# EasyEDA Pro project ProPrj_H750VBT6M2_2025-05-18.epro

# Schematic Schematic1
Board Name: Board1; Create Date: 2025-05-16; Page Name: P1; Project Name: H750VBT6M2; Schematic Name: Schematic1; Update Date: 2025-05-18; Company: 嘉立创EDA; Page Size: A4; Version: V1.0
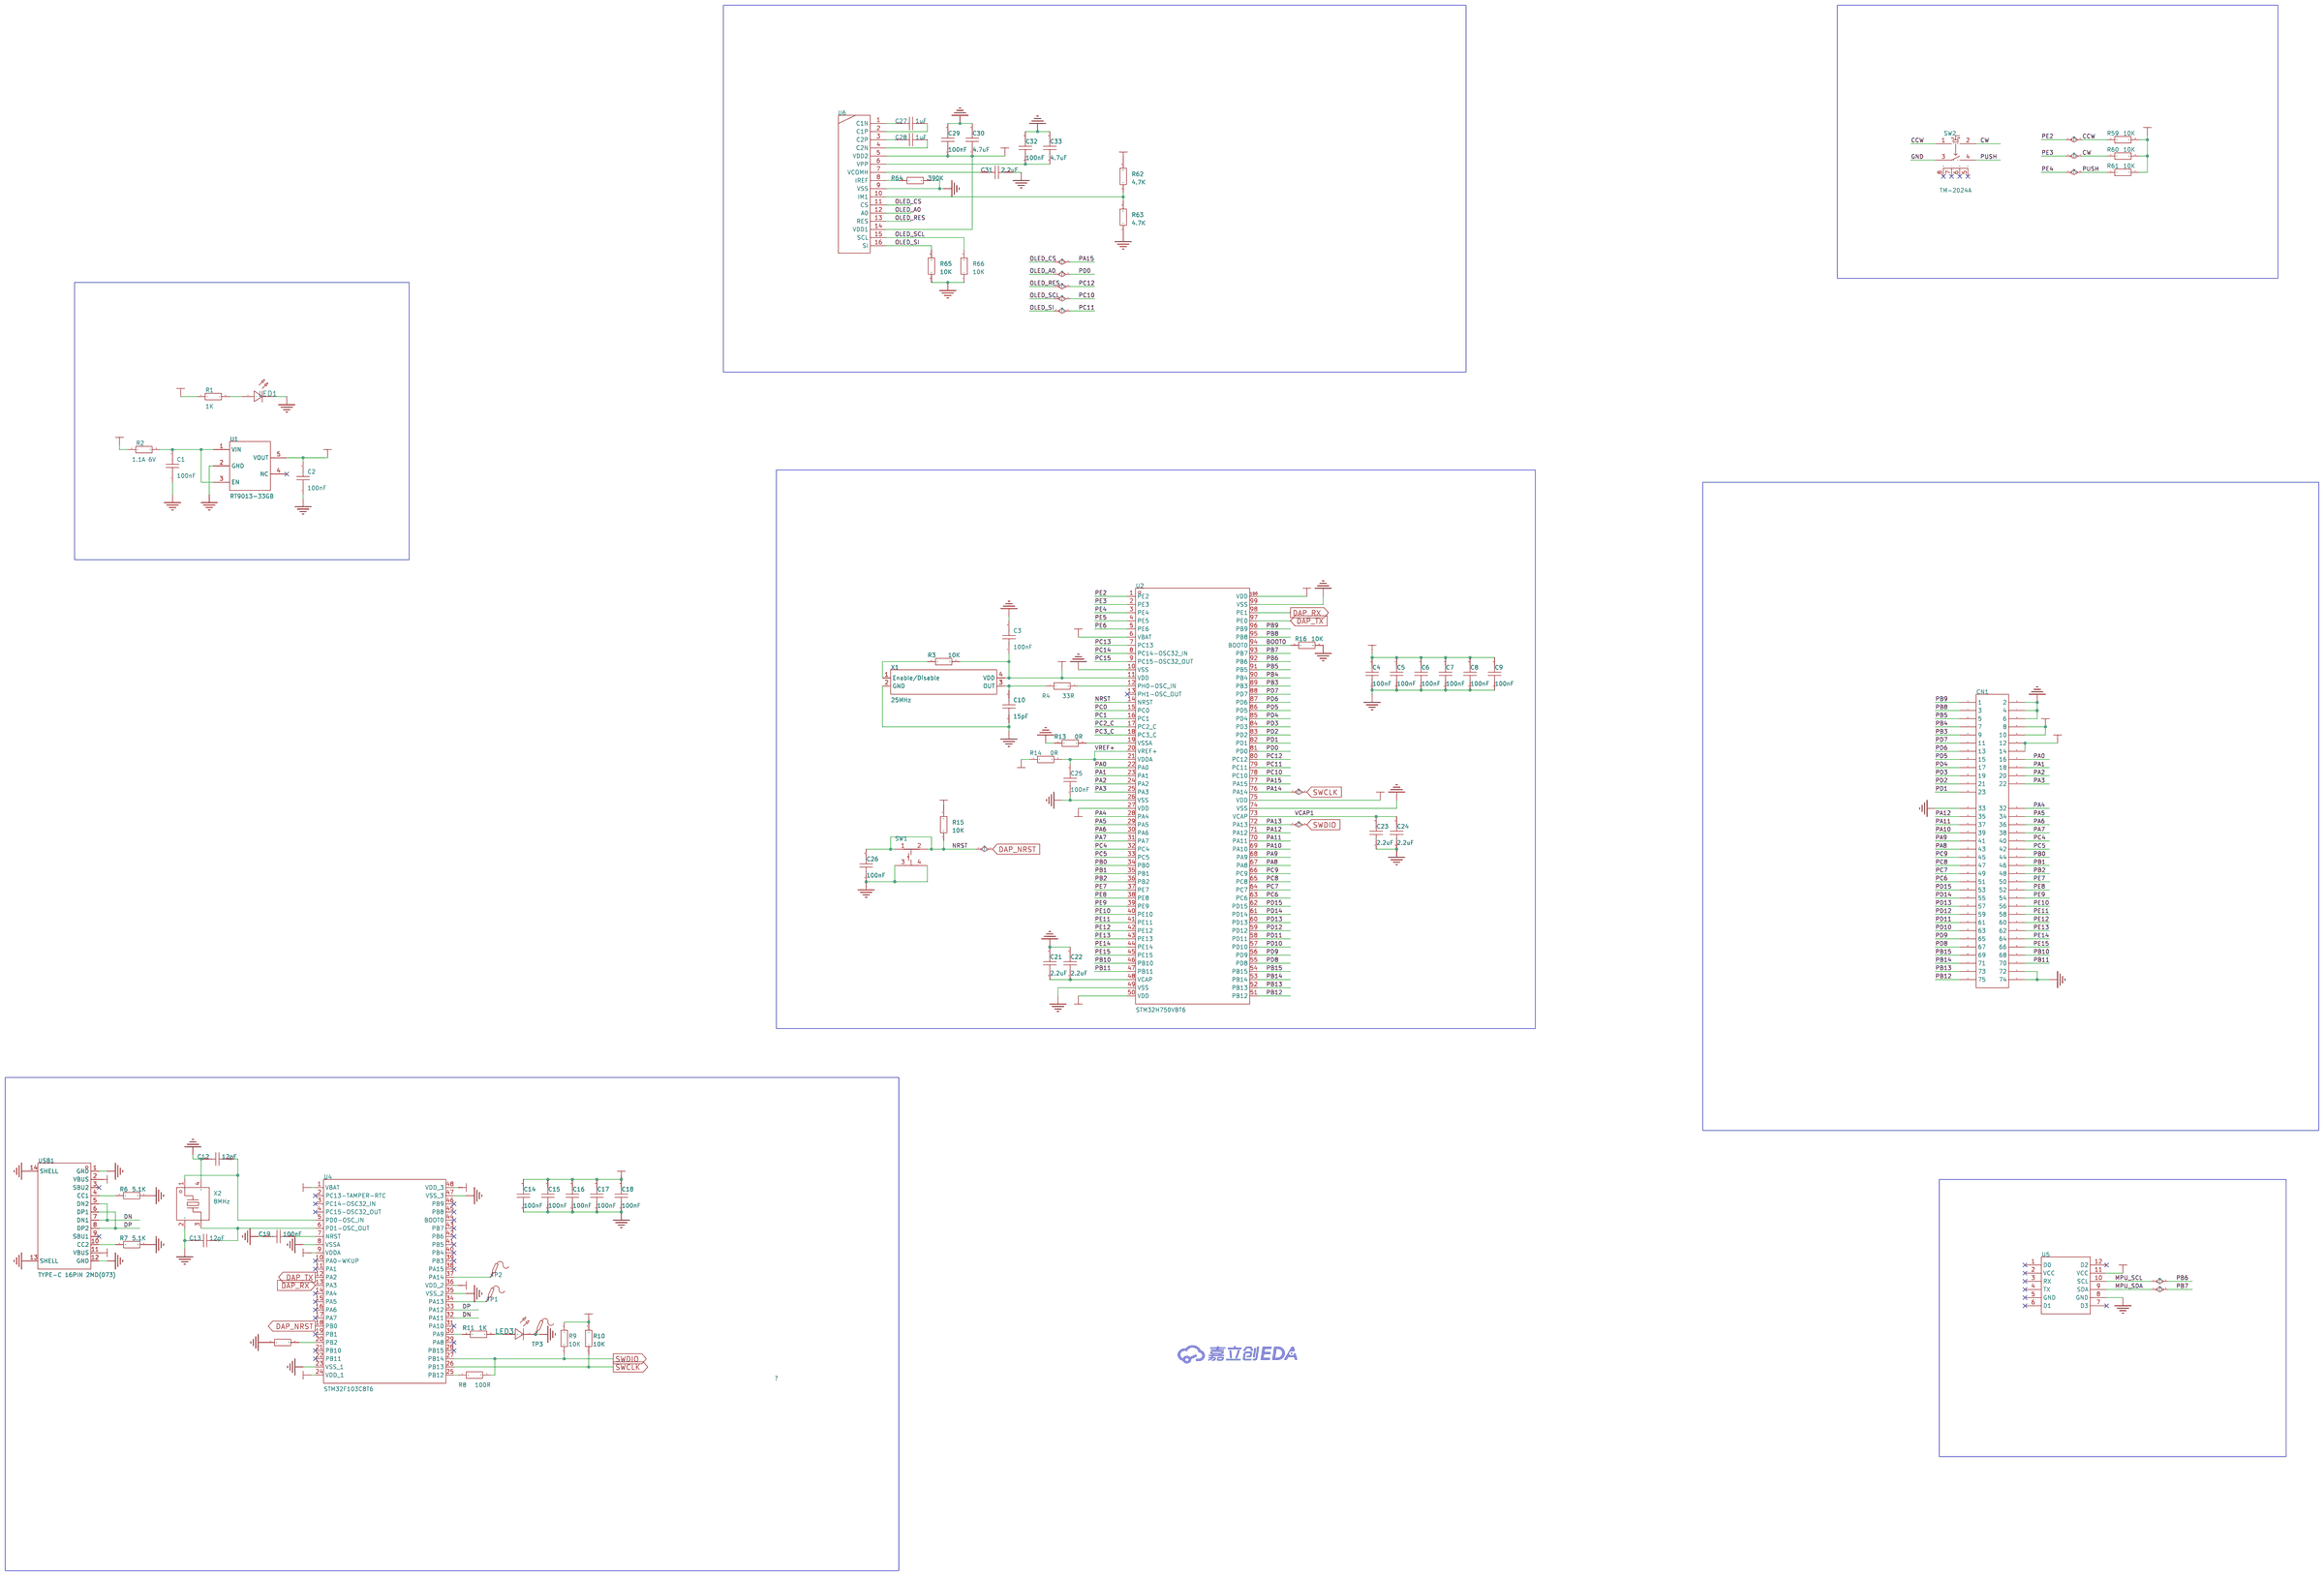
[diagram p0: schematic sheet]

## Parts
C1  100nF  [C0603]
C2  100nF  [C0603]
C3  100nF  [C0603]
C4  100nF  [C0603]
C5  100nF  [C0603]
C6  100nF  [C0603]
C7  100nF  [C0603]
C8  100nF  [C0603]
C9  100nF  [C0603]
C10  15pF  [C0603]
C12  12pF  [C0603]
C13  12pF  [C0603]
C14  100nF  [C0603]
C15  100nF  [C0603]
C16  100nF  [C0603]
C17  100nF  [C0603]
C18  100nF  [C0603]
C19  100nF  [C0603]
C21  2.2uF  [C0603]
C22  2.2uF  [C0603]
C23  2.2uF  [C0603]
C24  2.2uF  [C0603]
C25  100nF  [C0603]
C26  100nF  [C0603]
C27  1uF  [C0603]
C28  1uF  [C0603]
C29  100nF  [C0603]
C30  4.7uF  [C0603]
C31  2.2uF  [C0603]
C32  100nF  [C0603]
C33  4.7uF  [C0603]
CN1  M.2-E Key GF  [NGFF-M.2-75P-0.5mmE KEYGF]
LED1  -  [LED_0603]
LED3  -  [LED_0603]
R1  1K  [R0603]
R2  1.1A 6V  [R1206]
R3  10K  [R0603]
R4  33R  [R0603]
R6  5.1K  [R0603]
R7  5.1K  [R0603]
R8  100R  [R0603]
R9  10K  [R0603]
R10  10K  [R0603]
R11  1K  [R0603]
R12  10K  [R0603]
R13  0R  [R0603]
R14  0R  [R0603]
R15  10K  [R0603]
R16  10K  [R0603]
R59  10K  [R0603]
R60  10K  [R0603]
R61  10K  [R0603]
R62  4.7K  [R0603]
R63  4.7K  [R0603]
R64  390K  [R0603]
R65  10K  [R0603]
R66  10K  [R0603]
SW1  TS3425BA  [SW-SMD_4P-L4.2-W3.2-P2.15-LS4.6-1]
SW2  TM-2024A  [SW-SMD_TM-2024A]
TP1  -  [Test-Point-0.5mm]
TP2  -  [Test-Point-0.5mm]
TP3  -  [Test-Point-0.5mm]
U1  RT9013-33GB  [SOT-23-5_L3.0-W1.7-P0.95-LS2.8-BL]
U2  STM32H750VBT6  [LQFP-100_L14.0-W14.0-P0.50-LS16.0-BL]
U4  STM32F103C8T6  [LQFP-48_L7.0-W7.0-P0.50-LS9.0-BL]
U5  -  [JY901S]
U6  -  [1.29oled_spi_焊接_ch1115]
USB1  TYPE-C 16PIN 2MD(073)  [USB-C-SMD_TYPE-C-6PIN-2MD-073]
X1  25MHz  [OSC-SMD_4P-L3.2-W2.5-BL]
X2  8MHz  [CRYSTAL-SMD_4P-L3.2-W2.5-BL]

## Library data of the parts
C1-C10 C12-C19 C21-C33 = CAP_0603: Supplier Footprint: 0603
CN1 = M.2-E Key GF: Standardization Check: false; Check: false
LED1 LED3 = LED_0603-R: Supplier Footprint: 0603
R1 R3 R4 R6-R16 R59-R66 = Res_0603: Supplier Footprint: 0603
R2 = Res_1206: Supplier Footprint: 1206
SW1 = TS3425BA: 电路结构:单刀单掷;按钮形状:椭圆形按钮;作用力:250gf;安装方式:立贴;开关长度:4.2mm;开关宽度:3.2mm;开关高度:2.5mm;带支架:不带;触点电流:50mA;额定电压(DC):12V;绝缘电阻:100MΩ;机械寿命:10万次;; LCSC Part Name: 4.2*3.2*2.5mm 立贴 轻触开关; Supplier Part: C2681476; Manufacturer: SHOU HAN(首韩); Supplier Footprint: SMD; JLCPCB Part Class: 扩展库; Datasheet: https://atta.szlcsc.com/upload/public/pdf/source/20210107/C2681476_BF217B2301F0070AA49504CB0BFDE895.pdf; Supplier: LCSC; Circuit: 单刀单掷; Actuator Style: 椭圆形按钮; Operating Force: 250gf; Mounting Style: 立贴; Switch Length: 4.2mm; Switch Width: 3.2mm; Switch Height: 2.5mm; Strike Gundam: 不带; Contact Current: 50mA; Voltage Rating (DC): 12V; Insulation Resistance: 100MΩ; Actuator/Cap Color: 白色; Pin Style: J型引脚; Mechanical Life: 10万次; Operating Temperature: -20℃~+85℃
SW2 = TM-2024A: LCSC Part Name: 四脚两档拨轮开关TM-2024A; Supplier Part: C561480; Manufacturer: XKB Connection(中国星坤); Supplier Footprint: SMD; JLCPCB Part Class: 扩展库; Datasheet: https://atta.szlcsc.com/upload/public/pdf/source/20211011/7A4DB3DC37E7D5823B6D92C66ED3191E.pdf; Supplier: LCSC
TP1-TP3 = Test-Point: Test Point 测试点
U1 = RT9013-33GB: 输出类型:固定;最大输入电压:5.5V;输出电压:3.3V;输出电流:500mA;电源纹波抑制比(PSRR):50dB@(10kHz);输出极性:正极;; LCSC Part Name: 输入5.5V 输出3.3V 500mA; Supplier Part: C47773; Manufacturer: RICHTEK(立锜); Supplier Footprint: SOT-23-5; JLCPCB Part Class: 扩展库; Datasheet: https://atta.szlcsc.com/upload/public/pdf/source/20150504/1457707282459.pdf; Supplier: LCSC; Output Type: 固定; Maximum Input Voltage: 5.5V; Output Voltage: 3.3V; Output Current: 500mA; Power Supply Rejection Ratio (PSRR): 50dB@(10kHz); Dropout Voltage: 400mV@(500mA); standby current: 50uA; Feature: 低ESR；防静电保护；热保护(TSD)；过流保护(OCP)；带使能; Operating Temperature: -40℃~+85℃; Output Polarity: 正极; Number of Outputs: 1
U2 = STM32H750VBT6: CPU内核:ARM-M系列;CPU最大主频:480MHz;应用领域:-;; LCSC Part Name: 带DSP和DP-FPU的高性能ARM Cortex-M7 MCU，具有128 KB Flash、1 MB RAM、480 MHz CPU、一级缓存、外部存储器接口、JPEG编解码器、硬件加密和大量外设; Supplier Part: C404010; Manufacturer: ST(意法半导体); Supplier Footprint: LQFP-100(14x14); JLCPCB Part Class: 扩展库; Datasheet: https://atta.szlcsc.com/upload/public/pdf/source/20231008/912982D4F3BD3DF1AA7D0A7EE6EF5B6B.pdf; Supplier: LCSC; CPU Core: ARM-M系列; CPU Maximum Speed: 480MHz; Program Storage Size: 128KB; Program Memory Type: FLASH; Number of I/O: 82; ADC (Bit): 16bit; DAC (Bit): 12bit; Voltage - Supply: 1.62V~3.6V
U4 = STM32F103C8T6: CPU内核:ARM-M3;程序存储容量:64KB;RAM总容量:20KB;GPIO端口数量:37;工作电压范围:2V~3.6V;CPU最大主频:72MHz;程序存储器类型:FLASH;; Supplier Part: C8734; Manufacturer: ST(意法半导体); Supplier Footprint: LQFP-48(7x7); JLCPCB Part Class: 扩展库; Datasheet: https://atta.szlcsc.com/upload/public/pdf/source/20220812/8363ACEC51AD55ECEB84799464F7CB85.pdf; Supplier: LCSC; CPU Core: ARM-M3; Program Storage Size: 64KB; RAM Size: 20KB; GPIO Ports Number: 37; Operating Voltage Range: 2V~3.6V; CPU Maximum Speed: 72MHz; Program Memory Type: FLASH; Operating Temperature Range: -40℃~+85℃; ADC (Bit): 12bit; Universal Serial Bus: 有; Peripheral/Function: 看门狗；DMA；看门狗；温度传感器; Watchdog: 有; Infrared Data Association: 有; Low-Voltage Detect: 有; Direct Memory Access: 有; Internal Oscillator: 有
U5 = JY901S
U6 = 1.29oled_spi_焊接_ch1115
USB1 = TYPE-C 16PIN 2MD(073): 连接器类型:Type-C;标准:USB 3.1;公母:母;安装方式:卧贴;触点数量:16P;端口数量:1;额定电流 - 电源:5A;工作温度范围:-25℃~+85℃;; LCSC Part Name: Type-C 母 卧贴; Supplier Part: C2765186; Manufacturer: SHOU HAN(首韩); Supplier Footprint: SMD; JLCPCB Part Class: 扩展库; Datasheet: https://atta.szlcsc.com/upload/public/pdf/source/20211123/39B17C16241EAC15C5E277BDA434118E.pdf; Supplier: LCSC; Connector Type: Type-C; Standard: USB 3.1; Gender: 母; Mounting Style: 卧贴; Number of Contacts: 16P; Number of Ports: 1; Current Rating - Power (Max): 5A; Operating Temperature Range: -25℃~+85℃; Rated Voltage (Max): 5V; Connect-Disconnect Life: 5千次; Core Colour: 黑色
X1 = OT322525MJBA4SL: 频率:25MHz;常温频差:±10ppm;输出模式:CMOS;工作电压:1.8V~3.3V;工作电流:5mA;频率稳定度:±20ppm;; LCSC Part Name: YSO110TR 25MHZ 4P 3225 1.8V-3.3V ±10PPM -40~85℃（±20PPM) CMOS; Supplier Part: C669088; Manufacturer: YXC(扬兴晶振); Supplier Footprint: SMD3225-4P; JLCPCB Part Class: 扩展库; Datasheet: https://atta.szlcsc.com/upload/public/pdf/source/20240731/596E5F7673E50DA744B7F79F139FB8DF.pdf; Supplier: LCSC; Normal temperature Frequency Tolerance: ±10ppm; Output Type: CMOS; Voltage - Supply: 1.8V~3.3V; Current - Supply: 5mA; Frequency Stability: ±20ppm; Operating Temperature: -40℃~+85℃
X2 = X32258MSB4SI: 晶振类型:贴片晶振;频率:8MHz;常温频差:±10ppm;负载电容:20pF;频率稳定度:±20ppm;; LCSC Part Name: 8MHz ±10ppm 20pF; Supplier Part: C2682774; Manufacturer: YXC(扬兴晶振); Supplier Footprint: SMD3225-4P; JLCPCB Part Class: 扩展库; Datasheet: https://atta.szlcsc.com/upload/public/pdf/source/20240329/19D5F850207469550BEB00D7DFEDBC7A.pdf; Supplier: LCSC; Type: 贴片晶振; Normal temperature Frequency Tolerance: ±10ppm; Load Capacitance: 20pF; Frequency Stability: ±20ppm; Operating Temperature: -40℃~+85℃

## Nets
3V3: C2.2 C3.1 C4.2 C5.2 C6.2 C7.2 C8.2 C9.2 C14.2 C15.2 C16.2 C17.2 C18.2 C29.1 C30.1 CN1.12 CN1.14 R1.1 R3.2 R9.2 R10.2 R14.1 R15.2 R59.2 R60.2 R61.2 R62.2 U1.5(VOUT) U2.6(VBAT) U2.11(VDD) U2.27(VDD) U2.50(VDD) U2.75(VDD) U2.100(VDD) U4.1(VBAT) U4.9(VDDA) U4.24(VDD_1) U4.36(VDD_2) U4.48(VDD_3) U5.11(VCC) U6.5(VDD2) U6.14(VDD1) X1.4(VDD)
5V: CN1.8 CN1.10 R2.1 USB1.2(VBUS) USB1.11(VBUS)
GND: C1.1 C2.1 C3.2 C4.1 C5.1 C6.1 C7.1 C8.1 C9.1 C10.1 C12.2 C13.1 C14.1 C15.1 C16.1 C17.1 C18.1 C19.1 C21.2 C22.2 C23.1 C24.1 C25.1 C26.1 C29.2 C30.2 C31.2 C32.2 C33.2 CN1.2 CN1.4 CN1.6 CN1.33 CN1.72 CN1.74 LED1.1(C) LED3.1(C) R6.2 R7.2 R12.1 R13.1 R16.2 R63.1 R64.2 R65.1 R66.1 SW1.3 SW1.4 SW2.3 TP3.1 U1.2(GND) U2.10(VSS) U2.26(VSS) U2.49(VSS) U2.74(VSS) U2.99(VSS) U4.8(VSSA) U4.23(VSS_1) U4.35(VSS_2) U4.47(VSS_3) U5.8(GND) U6.9(VSS) USB1.1(GND) USB1.12(GND) USB1.13(SHELL) USB1.14(SHELL) X1.2(GND) X2.2(GND) X2.4(GND)
BOOT0: R16.1 U2.94(BOOT0)
CCW: R59.1 SW2.1 U2.1(PE2)
CW: R60.1 SW2.2 U2.2(PE3)
DAP_NRST: C26.2 R15.1 SW1.1 SW1.2 U2.14(NRST) U4.18(PB0)
DAP_RX: U2.98(PE1) U4.13(PA3)
DAP_TX: U2.97(PE0) U4.12(PA2)
DN: U4.32(PA11) USB1.5(DN2) USB1.7(DN1)
DP: U4.33(PA12) USB1.6(DP1) USB1.8(DP2)
MPU_SCL: U2.92(PB6) U5.10(SCL)
MPU_SDA: U2.93(PB7) U5.9(SDA)
OLED_A0: U2.81(PD0) U6.12(A0)
OLED_CS: U2.77(PA15) U6.11(CS)
OLED_RES: U2.80(PC12) U6.13(RES)
OLED_SCL: R66.2 U2.78(PC10) U6.15(SCL)
OLED_SI: R65.2 U2.79(PC11) U6.16(SI)
PA0: CN1.16 U2.22(PA0)
PA1: CN1.18 U2.23(PA1)
PA2: CN1.20 U2.24(PA2)
PA3: CN1.22 U2.25(PA3)
PA4: CN1.32 U2.28(PA4)
PA5: CN1.34 U2.29(PA5)
PA6: CN1.36 U2.30(PA6)
PA7: CN1.38 U2.31(PA7)
PA8: CN1.43 U2.67(PA8)
PA9: CN1.41 U2.68(PA9)
PA10: CN1.39 U2.69(PA10)
PA11: CN1.37 U2.70(PA11)
PA12: CN1.35 U2.71(PA12)
PA13: R8.2 R9.1 U2.72(PA13) U4.27(PB14)
PA14: R10.1 U2.76(PA14) U4.26(PB13)
PB0: CN1.44 U2.34(PB0)
PB1: CN1.46 U2.35(PB1)
PB2: CN1.48 U2.36(PB2)
PB3: CN1.9 U2.89(PB3)
PB4: CN1.7 U2.90(PB4)
PB5: CN1.5 U2.91(PB5)
PB8: CN1.3 U2.95(PB8)
PB9: CN1.1 U2.96(PB9)
PB10: CN1.68 U2.46(PB10)
PB11: CN1.70 U2.47(PB11)
PB12: CN1.75 U2.51(PB12)
PB13: CN1.73 U2.52(PB13)
PB14: CN1.71 U2.53(PB14)
PB15: CN1.69 U2.54(PB15)
PC0: U2.15(PC0)
PC1: U2.16(PC1)
PC2_C: U2.17(PC2_C)
PC3_C: U2.18(PC3_C)
PC4: CN1.40 U2.32(PC4)
PC5: CN1.42 U2.33(PC5)
PC6: CN1.51 U2.63(PC6)
PC7: CN1.49 U2.64(PC7)
PC8: CN1.47 U2.65(PC8)
PC9: CN1.45 U2.66(PC9)
PC13: U2.7(PC13)
PC14: U2.8(PC14-OSC32_IN)
PC15: U2.9(PC15-OSC32_OUT)
PD1: CN1.23 U2.82(PD1)
PD2: CN1.21 U2.83(PD2)
PD3: CN1.19 U2.84(PD3)
PD4: CN1.17 U2.85(PD4)
PD5: CN1.15 U2.86(PD5)
PD6: CN1.13 U2.87(PD6)
PD7: CN1.11 U2.88(PD7)
PD8: CN1.67 U2.55(PD8)
PD9: CN1.65 U2.56(PD9)
PD10: CN1.63 U2.57(PD10)
PD11: CN1.61 U2.58(PD11)
PD12: CN1.59 U2.59(PD12)
PD13: CN1.57 U2.60(PD13)
PD14: CN1.55 U2.61(PD14)
PD15: CN1.53 U2.62(PD15)
PE4: R61.1 SW2.4 U2.3(PE4)
PE5: U2.4(PE5)
PE6: U2.5(PE6)
PE7: CN1.50 U2.37(PE7)
PE8: CN1.52 U2.38(PE8)
PE9: CN1.54 U2.39(PE9)
PE10: CN1.56 U2.40(PE10)
PE11: CN1.58 U2.41(PE11)
PE12: CN1.60 U2.42(PE12)
PE13: CN1.62 U2.43(PE13)
PE14: CN1.64 U2.44(PE14)
PE15: CN1.66 U2.45(PE15)
VCAP1: C23.2 C24.2 U2.73(VCAP)
VREF+: C25.2 R14.2 U2.20(VREF+) U2.21(VDDA)
$1N1959: LED1.2(A) R1.2
$1N3867: C10.2 R4.1 X1.3(OUT)
$1N3874: R13.2 U2.19(VSSA)
$1N3903: C21.1 C22.1 U2.48(VCAP)
$1N5342: R4.2 U2.12(PH0-OSC_IN)
$1N5395: R3.1 X1.1(Enable/Disable)
$1N7049: C13.2 U4.6(PD1-OSC_OUT) X2.3
$1N7718: R7.1 USB1.10(CC2)
$1N7761: R6.1 USB1.4(CC1)
$1N7868: TP1.1 U4.34(PA13)
$1N7872: TP2.1 U4.37(PA14)
$1N7979: R8.1 U4.25(PB12)
$1N8280: R11.1 U4.30(PA9)
$1N8284: LED3.2(A) R11.2
$1N8434: R12.2 U4.20(PB2)
$1N8564: C19.2 U4.7(NRST)
$1N12613: C27.2 U6.2(C1P)
$1N12618: C27.1 U6.1(C1N)
$1N12623: C28.2 U6.4(C2N)
$1N12629: C28.1 U6.3(C2P)
$1N12870: R62.1 R63.2 U6.10(IM1)
$1N12999: R64.1 U6.8(IREF)
$1N13129: C32.1 C33.1 U6.6(VPP)
$1N13135: C31.1 U6.7(VCOMH)
$1N13313: C12.1 U4.5(PD0-OSC_IN) X2.1
Net-(C1-2): C1.2 R2.2 U1.1(VIN) U1.3(EN)

Not connected (* = marked no-connect by the designer): SW2 5* 6* 7* 8*; U1 4(NC)*; U2 13(PH1-OSC_OUT)*; U4 2(PC13-TAMPER-RTC)* 3(PC14-OSC32_IN)* 4(PC15-OSC32_OUT)* 10(PA0-WKUP)* 11(PA1)* 14(PA4)* 15(PA5)* 16(PA6)* 17(PA7)* 19(PB1)* 21(PB10)* 22(PB11)* 28(PB15)* 29(PA8)* 31(PA10)* 38(PA15)* 39(PB3)* 40(PB4)* 41(PB5)* 42(PB6)* 43(PB7)* 44(BOOT0)* 45(PB8)* 46(PB9)*; U5 1(D0)* 2(VCC)* 3(RX)* 4(TX)* 5(GND)* 6(D1)* 7(D3)* 12(D2)*; USB1 3(SBU2)* 9(SBU1)*

# Board PCB1
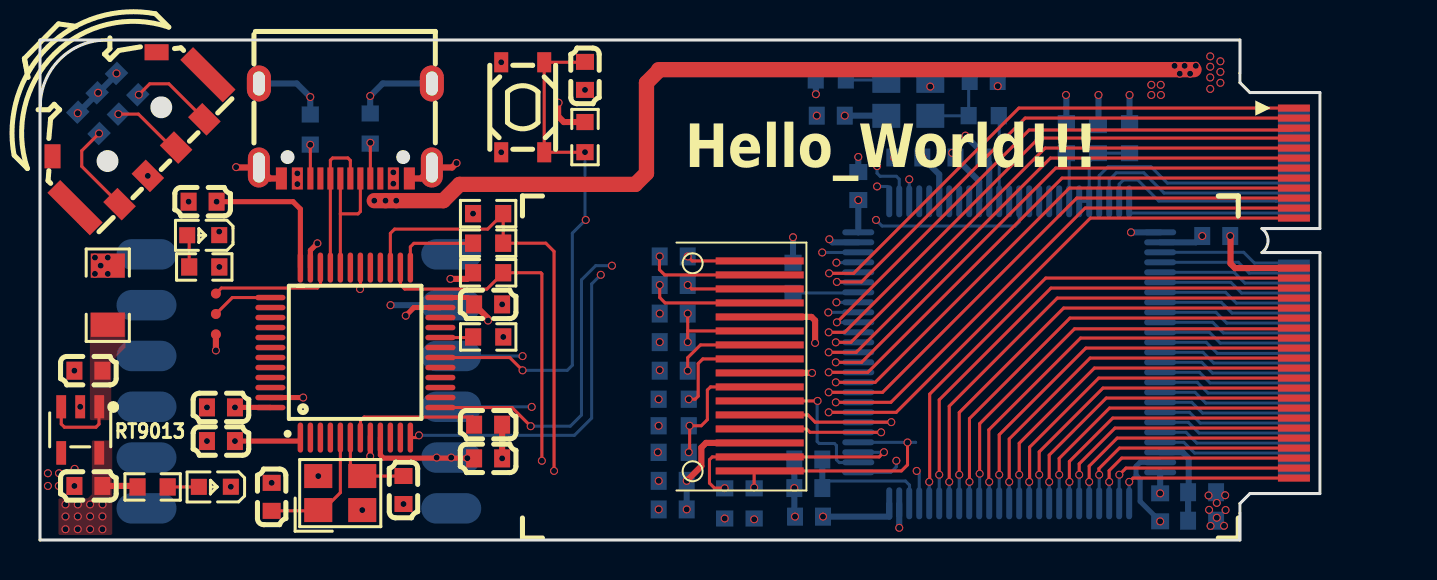
[diagram p1: board, top side]
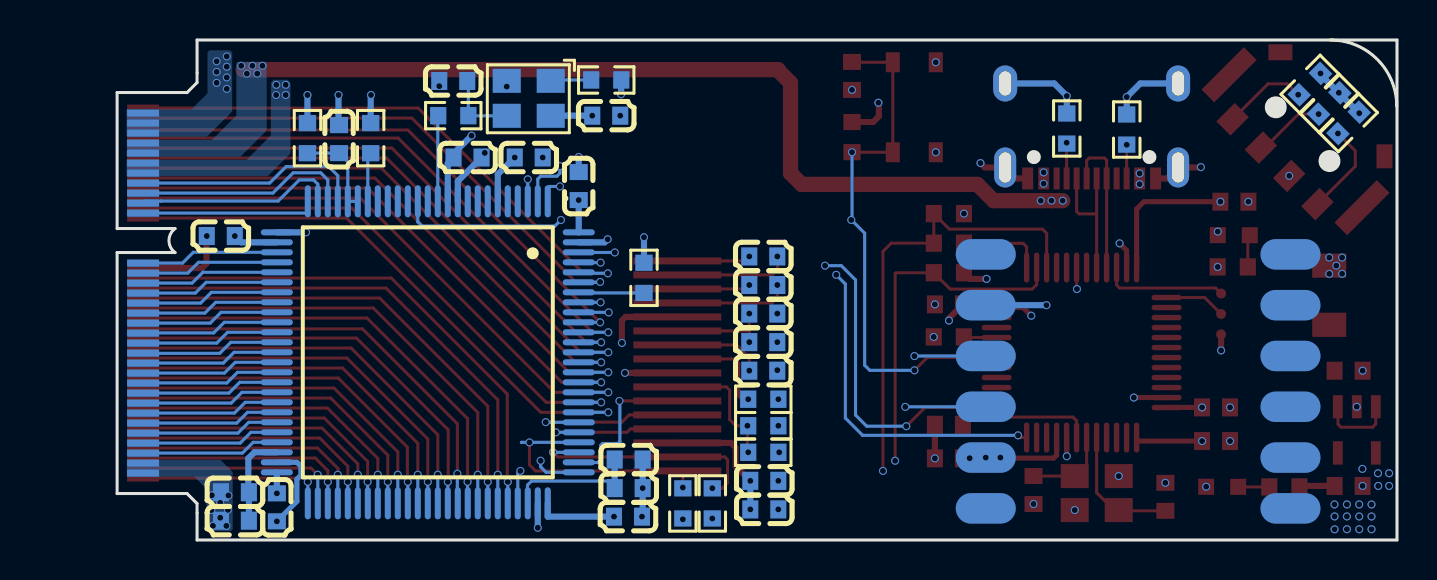
[diagram p2: board, bottom side, seen from below]

Outline 64.01 x 25 mm; copper layers: Top Layer, Inner1, Inner2, Inner3, Inner4, Bottom Layer. Coordinates in mm from the lower left corner of the outline.
Outline path: 0.01,21.68 arc(0.98,24.03) 3.33,25 ; 60.01,23.35 60.01,25 0,25 0,0 60.01,0 60.01,1.35
Stack: Top Layer 0.035mm 外层铜厚1oz / Dielectric1 0.0994mm 3313 RC57% 4.2mil / Inner1 0.0152mm 内层铜厚 / Dielectric2 0.55mm 0.55mm H/H No copper / Inner2 0.0152mm 内层铜厚 / Dielectric3 0.1088mm 2116 RC54% 4.9mil / Inner3 0.0152mm 内层铜厚 / Dielectric4 0.55mm 0.55mm H/H No copper / Inner4 0.0152mm 内层铜厚 / Dielectric5 0.0994mm 3313 RC57% 4.2mil / Bottom Layer 0.035mm 外层铜厚1oz

## Design rules (mm)
net DN: DP1
net DP: DP1
template: 自定义配置
spacing copperThickness1oz (default): track to track 0.152, other pairs 0.15 to 0.152
spacing copperThickness2oz: track to track 0.203, other pairs 0.152 to 0.3
track width copperThickness1oz (default): min 0.127, default 0.152, max 2.54
track width copperThickness2oz: min 0.203, default 0.305, max 2.54
differential pair differentialPair (default): width min 0.127, default 0.254, max 2.54; gap min 0.152, default 0.152
via viaSize (default): diameter min 0.399, default 0.399, max 10; hole min 0.3, default 0.3, max 6.299
net 3V3 uses copperThickness2oz
net GND uses copperThickness2oz
net 5V uses copperThickness2oz

## Placement (name value [footprint] x y rotation side)
C1  100nF  [C0603]  2.42 8.47 0 top
C2  100nF  [C0603]  2.42 2.7 0 top
C3  100nF  [C0603]  39.55 21.22 180 bottom
C4  100nF  [C0603]  58.83 15.2 180 bottom
C5  100nF  [C0603]  43.43 19.12 0 bottom
C6  100nF  [C0603]  46.49 19.12 0 bottom
C7  100nF  [C0603]  38.46 1.17 0 bottom
C8  100nF  [C0603]  40.93 17.7 270 bottom
C9  100nF  [C0603]  56.02 1.63 90 bottom
C10  15pF  [C0603]  47.2 22.95 180 bottom
C12  12pF  [C0603]  11.59 2.16 90 top
C13  12pF  [C0603]  18.18 2.5 90 top
C14  100nF  [C0603]  9.05 6.63 0 top
C15  100nF  [C0603]  9.05 4.95 0 top
C16  100nF  [C0603]  22.41 4.08 180 top
C17  100nF  [C0603]  22.41 11.78 180 top
C18  100nF  [C0603]  8.13 16.92 0 top
C19  100nF  [C0603]  22.41 5.76 180 top
C21  2.2uF  [C0603]  58.12 2.39 0 bottom
C22  2.2uF  [C0603]  58.12 0.97 0 bottom
C23  2.2uF  [C0603]  38.43 4.02 0 bottom
C24  2.2uF  [C0603]  38.43 2.59 0 bottom
C25  100nF  [C0603]  52.91 20.04 270 bottom
C26  100nF  [C0603]  27.26 23.21 90 top
C27  1uF  [C0603]  31.69 14.18 180 bottom
C28  1uF  [C0603]  31.69 12.75 180 bottom
C29  100nF  [C0603]  31.64 2.96 180 bottom
C30  4.7uF  [C0603]  31.64 1.53 180 bottom
C31  2.2uF  [C0603]  31.69 8.47 180 bottom
C32  100nF  [C0603]  31.69 9.89 180 bottom
C33  4.7uF  [C0603]  31.69 11.32 180 bottom
CN1  M.2-E Key GF  [NGFF-M.2-75P-0.5mmE KEYGF]  64.01 12.35 270 top
LED1  -  [LED_0603]  8.69 2.65 180 top
LED3  -  [LED_0603]  8.11 15.23 180 top
R1  1K  [R0603]  5.63 2.65 0 top
R2  1.1A 6V  [R1206]  3.39 12.24 270 top
R3  10K  [R0603]  39.55 23 180 bottom
R4  33R  [R0603]  47.2 21.22 0 bottom
R6  5.1K  [R0603]  16.51 20.57 90 bottom
R7  5.1K  [R0603]  13.52 20.52 90 bottom
R8  100R  [R0603]  22.41 14.84 0 top
R9  10K  [R0603]  22.41 16.32 180 top
R10  10K  [R0603]  22.41 13.36 180 top
R11  1K  [R0603]  8.22 13.65 180 top
R12  10K  [R0603]  22.42 10.15 180 top
R13  0R  [R0603]  51.33 20.09 270 bottom
R14  0R  [R0603]  54.49 20.09 270 bottom
R15  10K  [R0603]  27.26 20.15 90 top
R16  10K  [R0603]  37.66 13.11 90 bottom
R59  10K  [R0603]  2.42 20.86 135 bottom
R60  10K  [R0603]  4.36 22.8 135 bottom
R61  10K  [R0603]  3.39 21.83 135 bottom
R62  4.7K  [R0603]  31.69 4.39 180 bottom
R63  4.7K  [R0603]  31.69 5.71 0 bottom
R64  390K  [R0603]  31.69 7.04 180 bottom
R65  10K  [R0603]  35.72 1.83 90 bottom
R66  10K  [R0603]  34.24 1.83 90 bottom
RT9013  RT9013-33GB  [SOT-23-5_L3.0-W1.7-P0.95-LS2.8-BL]  2.01 5.51 180 top
SW1  TS3425BA  [SW-SMD_4P-L4.2-W3.2-P2.15-LS4.6-1]  24.14 21.64 270 top
SW2  TM-2024A  [SW-SMD_TM-2024A]  4.66 20.35 45 top
TP1  -  [Test-Point-0.5mm]  8.8 12.32 0 top
TP2  -  [Test-Point-0.5mm]  8.8 11.3 0 top
TP3  -  [Test-Point-0.5mm]  8.8 10.28 0 top
U2  STM32H750VBT6  [LQFP-100_L14.0-W14.0-P0.50-LS16.0-BL]  48.47 9.38 0 bottom
U4  STM32F103C8T6  [LQFP-48_L7.0-W7.0-P0.50-LS9.0-BL]  15.77 9.37 0 top
U5  -  [JY901S]  5.33 1.58 0 bottom
U6  -  [1.29oled_spi_焊接_ch1115]  58.88 1.07 180 top
USB1  TYPE-C 16PIN 2MD(073)  [USB-C-SMD_TYPE-C-6PIN-2MD-073]  15.27 20.45 180 top
X1  25MHz  [OSC-SMD_4P-L3.2-W2.5-BL]  43.43 22.08 0 bottom
X2  8MHz  [CRYSTAL-SMD_4P-L3.2-W2.5-BL]  15.02 2.35 0 top

## Footprints (pads in the part's own frame, mm; a bottom-side part is the same pattern mirrored in y, then rotated)
1.29oled_spi_焊接_ch1115
  rect 4.4x0.35 smd: 1(22.884,-12.883) 2(22.884,-12.183) 3(22.884,-11.483) 4(22.884,-10.783) 5(22.884,-10.083) 6(22.884,-9.383) 7(22.884,-8.683) 8(22.884,-7.983) 9(22.884,-7.283) 10(22.884,-6.583) 11(22.884,-5.883) 12(22.884,-5.183) 13(22.884,-4.483) 14(22.884,-3.783) 15(22.884,-3.083) 16(22.884,-2.383)
C0603
  rect 0.8x0.9 smd: 1(-0.7,0) 2(0.7,0)
CRYSTAL-SMD_4P-L3.2-W2.5-BL
  rect 1.4x1.2 smd: 1(-1.1,-0.85) 2(1.1,-0.85) 3(1.1,0.85) 4(-1.1,0.85)
JY901S
  oval 3x1.524 smd: 1(0,0) 2(0,-2.54) 3(0,-5.08) 4(0,-7.62) 5(0,-10.16) 6(0,-12.7) 7(15.24,-12.7) 8(15.24,-10.16) 9(15.24,-7.62) 10(15.24,-5.08) 11(15.24,-2.54) 12(15.24,0)
LED_0603
  rect 0.8x0.8 smd: 1(-0.851,-0.01) 2(0.75,-0.005)
LQFP-48_L7.0-W7.0-P0.50-LS9.0-BL
  oval 0.27x1.5 smd: 1(-2.75,-4.25) 2(-2.25,-4.25) 3(-1.75,-4.25) 4(-1.25,-4.25) 5(-0.75,-4.25) 6(-0.25,-4.25) 7(0.25,-4.25) 8(0.75,-4.25) 9(1.25,-4.25) 10(1.75,-4.25) 11(2.25,-4.25) 12(2.75,-4.25) 25(2.75,4.25) 26(2.25,4.25) 27(1.75,4.25) 28(1.25,4.25) 29(0.75,4.25) 30(0.25,4.25) 31(-0.25,4.25) 32(-0.75,4.25) 33(-1.25,4.25) 34(-1.75,4.25) 35(-2.25,4.25) 36(-2.75,4.25)
  oval 1.5x0.27 smd: 13(4.25,-2.75) 14(4.25,-2.25) 15(4.25,-1.75) 16(4.25,-1.25) 17(4.25,-0.75) 18(4.25,-0.25) 19(4.25,0.25) 20(4.25,0.75) 21(4.25,1.25) 22(4.25,1.75) 23(4.25,2.25) 24(4.25,2.75) 37(-4.25,2.75) 38(-4.25,2.25) 39(-4.25,1.75) 40(-4.25,1.25) 41(-4.25,0.75) 42(-4.25,0.25) 43(-4.25,-0.25) 44(-4.25,-0.75) 45(-4.25,-1.25) 46(-4.25,-1.75) 47(-4.25,-2.25) 48(-4.25,-2.75)
LQFP-100_L14.0-W14.0-P0.50-LS16.0-BL
  oval 0.3x1.6 smd: 1(-6,-7.55) 2(-5.5,-7.55) 3(-5,-7.55) 4(-4.5,-7.55) 5(-4,-7.55) 6(-3.5,-7.55) 7(-3,-7.55) 8(-2.5,-7.55) 9(-2,-7.55) 10(-1.5,-7.55) 11(-1,-7.55) 12(-0.5,-7.55) 13(0,-7.55) 14(0.5,-7.55) 15(1,-7.55) 16(1.5,-7.55) 17(2,-7.55) 18(2.5,-7.55) 19(3,-7.55) 20(3.5,-7.55) 21(4,-7.55) 22(4.5,-7.55) 23(5,-7.55) 24(5.5,-7.55) 25(6,-7.55) 51(6,7.55) 52(5.5,7.55) 53(5,7.55) 54(4.5,7.55) 55(4,7.55) 56(3.5,7.55) 57(3,7.55) 58(2.5,7.55) 59(2,7.55) 60(1.5,7.55) 61(1,7.55) 62(0.5,7.55) 63(0,7.55) 64(-0.5,7.55) 65(-1,7.55) 66(-1.5,7.55) 67(-2,7.55) 68(-2.5,7.55) 69(-3,7.55) 70(-3.5,7.55) 71(-4,7.55) 72(-4.5,7.55) 73(-5,7.55) 74(-5.5,7.55) 75(-6,7.55)
  oval 1.6x0.3 smd: 26(7.55,-6) 27(7.55,-5.5) 28(7.55,-5) 29(7.55,-4.5) 30(7.55,-4) 31(7.55,-3.5) 32(7.55,-3) 33(7.55,-2.5) 34(7.55,-2) 35(7.55,-1.5) 36(7.55,-1) 37(7.55,-0.5) 38(7.55,0) 39(7.55,0.5) 40(7.55,1) 41(7.55,1.5) 42(7.55,2) 43(7.55,2.5) 44(7.55,3) 45(7.55,3.5) 46(7.55,4) 47(7.55,4.5) 48(7.55,5) 49(7.55,5.5) 50(7.55,6) 76(-7.55,6) 77(-7.55,5.5) 78(-7.55,5) 79(-7.55,4.5) 80(-7.55,4) 81(-7.55,3.5) 82(-7.55,3) 83(-7.55,2.5) 84(-7.55,2) 85(-7.55,1.5) 86(-7.55,1) 87(-7.55,0.5) 88(-7.55,0) 89(-7.55,-0.5) 90(-7.55,-1) 91(-7.55,-1.5) 92(-7.55,-2) 93(-7.55,-2.5) 94(-7.55,-3) 95(-7.55,-3.5) 96(-7.55,-4) 97(-7.55,-4.5) 98(-7.55,-5) 99(-7.55,-5.5) 100(-7.55,-6)
NGFF-M.2-75P-0.5mmE KEYGF
  rect 0.35x1.6 smd: 1(-9.25,-1.3) 3(-8.75,-1.3) 5(-8.25,-1.3) 7(-7.75,-1.3) 9(-7.25,-1.3) 11(-6.75,-1.3) 13(-6.25,-1.3) 15(-5.75,-1.3) 17(-5.25,-1.3) 19(-4.75,-1.3) 21(-4.25,-1.3) 23(-3.75,-1.3) 33(-1.25,-1.3) 35(-0.75,-1.3) 37(-0.25,-1.3) 39(0.25,-1.3) 41(0.75,-1.3) 43(1.25,-1.3) 45(1.75,-1.3) 47(2.25,-1.3) 49(2.75,-1.3) 51(3.25,-1.3) 53(3.75,-1.3) 55(4.25,-1.3) 57(4.75,-1.3) 59(5.25,-1.3) 61(5.75,-1.3) 63(6.25,-1.3) 65(6.75,-1.3) 67(7.25,-1.3) 69(7.75,-1.3) 71(8.25,-1.3) 73(8.75,-1.3) 75(9.25,-1.3)
  rect 0.35x1.6 smd far side: 2(-9,-1.3) 4(-8.5,-1.3) 6(-8,-1.3) 8(-7.5,-1.3) 10(-7,-1.3) 12(-6.5,-1.3) 14(-6,-1.3) 16(-5.5,-1.3) 18(-5,-1.3) 20(-4.5,-1.3) 22(-4,-1.3) 32(-1.5,-1.3) 34(-1,-1.3) 36(-0.5,-1.3) 38(0,-1.3) 40(0.5,-1.3) 42(1,-1.3) 44(1.5,-1.3) 46(2,-1.3) 48(2.5,-1.3) 50(3,-1.3) 52(3.5,-1.3) 54(4,-1.3) 56(4.5,-1.3) 58(5,-1.3) 60(5.5,-1.3) 62(6,-1.3) 64(6.5,-1.3) 66(7,-1.3) 68(7.5,-1.3) 70(8,-1.3) 72(8.5,-1.3) 74(9,-1.3)
OSC-SMD_4P-L3.2-W2.5-BL
  rect 1.4x1.2 smd: 1(-1.1,-0.875) 2(1.1,-0.875) 3(1.1,0.875) 4(-1.1,0.875)
R0603
  rect 0.806x0.864 smd: 1(-0.753,0) 2(0.753,0)
R1206
  rect 1.208x1.701 smd: 1(-1.479,0) 2(1.479,0)
SOT-23-5_L3.0-W1.7-P0.95-LS2.8-BL
  rect 0.49x1.157 smd: 1(-0.95,-1.153) 2(0,-1.153) 3(0.95,-1.153)
  rect 0.49x1.175 smd: 4(0.95,1.153) 5(-0.95,1.153)
SW-SMD_4P-L4.2-W3.2-P2.15-LS4.6-1
  rect 1x0.7 smd: 1(-2.25,1.075) 2(2.25,1.075) 3(-2.25,-1.075) 4(2.25,-1.075)
SW-SMD_TM-2024A
  rect 1x1.3 smd: 1(-3,-2.03) 2(3,-2.03) 3(-1,-2.03) 4(1,-2.03)
  rect 0.9x3 smd: 5(-4.7,-0.58) 6(4.7,-0.58)
  rect 1.2x0.8 smd rot 45: 7(-3.68,2.03)
  rect 1.2x0.8 smd rot 135: 8(3.68,2.03)
Test-Point-0.5mm
  round 0.5 smd: 1(0,0)
USB-C-SMD_TYPE-C-6PIN-2MD-073
  rect 0.55x1.1 smd: 1(-3.2,2.375) 2(-2.4,2.375) 11(2.4,2.375) 12(3.2,2.375)
  rect 0.3x1.1 smd: 3(-1.75,2.375) 4(-1.25,2.375) 5(-0.75,2.375) 6(-0.25,2.375) 7(0.25,2.375) 8(0.75,2.375) 9(1.25,2.375) 10(1.75,2.375)
  oval 1.1x2 hole 0.6x1.5: 13(-4.325,1.825) 14(4.325,1.825)
  oval 1.2x1.8 hole 0.6x1.2: 13(-4.325,-2.375) 14(4.325,-2.375)

## Nets
As in the schematic, except:
3V3: C2.2 C3.1 C4.2 C5.2 C6.2 C7.2 C8.2 C9.2 C14.2 C15.2 C16.2 C17.2 C18.2 C29.1 C30.1 CN1.12 CN1.14 R1.1 R3.2 R9.2 R10.2 R14.1 R15.2 R59.2 R60.2 R61.2 R62.2 RT9013.5 U2.6 U2.11 U2.27 U2.50 U2.75 U2.100 U4.1 U4.9 U4.24 U4.36 U4.48 U5.11 U6.5 U6.14 X1.4
GND: C1.1 C2.1 C3.2 C4.1 C5.1 C6.1 C7.1 C8.1 C9.1 C10.1 C12.2 C13.1 C14.1 C15.1 C16.1 C17.1 C18.1 C19.1 C21.2 C22.2 C23.1 C24.1 C25.1 C26.1 C29.2 C30.2 C31.2 C32.2 C33.2 CN1.2 CN1.4 CN1.6 CN1.33 CN1.72 CN1.74 LED1.1 LED3.1 R6.2 R7.2 R12.1 R13.1 R16.2 R63.1 R64.2 R65.1 R66.1 RT9013.2 SW1.3 SW1.4 SW2.3 TP3.1 U2.10 U2.26 U2.49 U2.74 U2.99 U4.8 U4.23 U4.35 U4.47 U5.8 U6.9 USB1.1 USB1.12 USB1.13 USB1.14 X1.2 X2.2 X2.4
$1N1960: C1.2 R2.2 RT9013.1 RT9013.3

Pads without a net: RT9013 4; SW2 5 6 7 8; U2 13; U4 2 3 4 10 11 14 15 16 17 19 21 22 28 29 31 38 39 40 41 42 43 44 45 46; U5 1 2 3 4 5 6 7 12; USB1 3 9

## Via types
v1: diameter 0.4, hole 0.3, Top Layer to Bottom Layer, 204 vias
v2: diameter 0.399, hole 0.299, Top Layer to Bottom Layer, 8 vias

## Routing (per net, layer and track width the routed paths; a pad name or vN(x,y) marks a point on that pad's centre or on a via; arc(x,y) is an arc through that point)
3V3: length 59.1
  Top Layer w0.254: U4.9 17.02,4.25 17.18,4.09 v1(21.37,4.09) 21.6,4.09 21.71,3.98 21.71,3.98 ; v1(9.75,6.63) 11.52,6.63 U4.48 ; C17.2 21.37,12.12 U4.24 ; v1(9.75,4.95) 13.02,4.95 U4.1 ; v1(8.83,16.92) 12.65,16.92 13.02,16.55 U4.36
  Top Layer w0.305: R10.2 21.35,13.06 v1(20.53,13.06) ; v1(32.34,2.96) 33.08,3.69 33.08,4.62 33.31,4.85 U6.14 ; U6.5 38.58,11.15 38.77,10.97 v1(38.77,9.86) ; C17.2 22.41,11.09 v1(22.41,10.97) ; v1(25.94,21.86) 25.91,21.84 25.91,21.18 26.2,20.9 27.26,20.9 ; R1.1 4.83,2.7 C2.2
  Bottom Layer w0.305: v1(46.28,20.22) 47.19,19.32 C6.2 47.47,18.84 U2.11 ; U2.100 40.93,15.39 v1(40.93,17) ; U2.27 57.81,14.88 v1(58.13,15.2) ; v1(2.91,22.36) 2.91,22.41 ; v1(2.91,22.36) v1(1.89,21.34) ; v1(2.91,22.36) 3.83,23.28 v1(3.83,23.33) ; v1(38.81,22.29) 38.81,22.99 R3.2 ; v1(32.34,1.53) v1(32.34,2.96) ; v1(44.13,19.12) 44.97,18.28 U2.6 ; v1(56.02,2.33) 56.02,2.33 U2.50 ; v1(39.16,1.17) 42.47,1.17 U2.75 ; 42.53,21.21 42.52,21.22 v1(40.25,21.22) ; R14.1 v1(54.49,22.25)
  vias: v1(1.28,1.78) v1(1.28,1.18) v1(1.28,0.54) v1(1.89,1.78) v1(1.89,1.18) v1(1.89,0.54) v1(2.5,1.78) v1(2.51,1.18) v1(2.51,0.54) v1(3.13,1.78) v1(3.12,1.18) v1(3.12,0.53) v1(19.84,4.12) v1(20.57,4.12) v1(21.66,16.32) v1(30.9,4.39) v1(55.58,22.76) v1(55.58,22.25) v1(56.05,22.76) v1(56.06,22.25)
5V: length 46.3
  Top Layer w0.762: 57.71,23.52 30.94,23.52 ; v1(16.72,16.97) v1(17.28,16.97) v1(17.82,16.97) 20.17,16.97 20.99,17.78 29.77,17.78 30.33,18.34 30.33,22.86 30.94,23.47
  vias: v1(2.75,14.12) v1(2.75,13.31) v1(3.03,13.72) v1(3.39,14.12) v1(3.39,13.31) v1(12.87,18.33) v1(12.87,17.79) v1(17.67,18.38) v1(17.67,17.82) v1(56.74,23.71) v1(57,23.32) v1(57.25,23.71) v1(57.52,23.32) v1(57.81,23.71)
GND: length 51.1
  Top Layer w0.254: v1(18.29,11.22) 18.7,11.62 U4.23 ; v1(16.51,4.19) 16.52,4.2 16.52,5.2 ; U4.35 13.52,14.48 v1(13.87,14.83) ; U4.47 v1(13.16,7.12)
  Top Layer w0.305: v1(9.81,18.64) 9.83,18.63 USB1.14 11.5,18.08 USB1.12 ; v1(59.53,15.2) 59.54,15.18 59.54,13.82 59.76,13.6 CN1.33 ; U6.9 v1(38.61,8.35) ; TP3.1 v1(8.8,9.48) ; v1(20.83,18.85) 20.61,18.63 USB1.13 19.05,18.08 USB1.1 ; C19.1 v1(23.11,4.08)
  Bottom Layer w0.254: U2.49 55.02,3.88 54.82,3.69 54.82,3.24 55.02,3.04 55.02,1.93 v1(56.02,0.93)
  Bottom Layer w0.305: C6.1 46.97,17.94 U2.10 ; U2.74 v1(42.97,0.61) ; R7.2 v1(13.52,22.15) 12.84,22.83 USB1.14 ; v1(52.94,22.25) 52.94,20.77 C25.1 ; R16.2 v1(37.66,15.14) ; R6.2 v1(16.51,22.2) 17.14,22.83 USB1.13 ; U5.8 v1(17.53,11.74) ; C23.1 v1(37.73,2.59) 37.73,1.2 v1(37.76,1.17) ; v1(39.48,15.04) 39.63,14.88 U2.99 ; U2.26 v1(54.56,15.38) ; 40.93,18.4 v1(40.93,19.15) ; v1(51.31,22.25) 51.33,22.23 R13.1
  vias: v1(0.4,3.34) v1(0.4,2.7) v1(0.94,2.7) v1(0.95,3.34) v1(1.72,8.47) v1(1.73,3.56) v1(1.72,2.7) v1(2.01,6.66) v1(5.39,18.21) v1(7.43,16.92) v1(8.35,6.63) v1(8.35,4.95) v1(8.96,15.42) v1(9.54,2.66) v1(11.59,2.86) v1(13.92,3.2) v1(16.12,1.5) v1(18.18,1.8) v1(23.07,23.89) v1(23.07,19.39) v1(23.11,11.78) v1(23.17,10.15) v1(27.26,22.51) v1(30.94,7.04) v1(30.94,5.71) v1(30.94,2.96) v1(30.94,1.53) v1(30.99,11.32) v1(30.99,9.89) v1(30.99,8.49) v1(34.24,1.08) v1(35.72,1.03) v1(38.85,21.22) v1(42.73,19.12) v1(44.53,22.67) v1(45.62,19.36) v1(47.9,22.69) v1(58.53,24.18) v1(58.53,23.66) v1(58.53,23.13) v1(58.53,22.56) v1(59.03,23.94) v1(59.03,23.41) v1(59.03,22.86) v2(58.44,2.23) v2(58.47,1.51) v2(58.54,0.7) v2(58.85,1.86) v2(58.86,1.11) v2(59.22,0.71) v2(59.28,2.24) v2(59.29,1.5)
BOOT0: length 3.3
  Bottom Layer w0.152: R16.1 40.89,12.35 U2.94
CCW: length 47.2
  Top Layer w0.152: SW2.1 2.09,18.68 2.09,19.46 v1(2.95,20.33)
  Inner3 w0.152: v1(41.86,17.68) 35.41,17.68 34.7,18.39 34.7,20.31 34.59,20.42 3.05,20.42 v1(2.95,20.33)
  Bottom Layer w0.152: v1(41.86,17.68) 42.37,17.68 42.47,17.58 U2.1
CW: length 46.5
  Top Layer w0.152: v1(4.94,22.26) 5.49,22.81 6.45,22.81 8.22,21.03
  Inner3 w0.152: v1(41.86,18.69) 36.07,18.69 35.72,19.05 35.72,20.78 35.26,21.23 7.83,21.23 6.56,22.5 5.18,22.5 v1(4.94,22.26)
  Bottom Layer w0.152: v1(41.86,18.69) 41.86,18.34 42.02,18.19 42.83,18.19 42.97,18.04 U2.2
DAP_NRST: length 49.4
  Top Layer w0.152: C26.2 27.24,23.89 SW1.1 SW1.2 27.25,19.39 v1(27.26,19.39) ; v1(24.13,8.48) 23.5,9.12 U4.18
  Inner3 w0.152: v1(41.81,16) v1(27.29,16)
  Bottom Layer w0.152: v1(24.13,8.48) 26.37,8.48 26.62,8.74 26.62,15.34 27.26,15.97 v1(27.26,19.39) ; U2.14 48.97,15.9 48.77,15.7 42.12,15.7 v1(41.81,16)
DAP_RX: length 28.8
  Top Layer w0.152: U4.13 23.61,6.62 v1(24.54,5.69)
  Inner3 w0.152: v1(39.12,14.38) 38.46,13.72 v1(28.61,13.72)
  Bottom Layer w0.152: v1(39.12,14.38) 40.92,14.38 U2.98 ; v1(24.54,5.69) 26.52,5.69 27.08,6.25 27.08,13 27.79,13.72 v1(28.61,13.72)
DAP_TX: length 30
  Top Layer w0.152: U4.12 18.84,5.12 v1(18.95,5.23)
  Inner3 w0.152: v1(28.05,13.26) 38.61,13.26 39.22,13.87 v1(39.83,13.87)
  Bottom Layer w0.152: v1(18.95,5.23) 26.73,5.23 27.59,6.1 27.59,12.8 v1(28.05,13.26) ; v1(39.83,13.87) 40.91,13.87 U2.97
DN: length 7.2
  Top Layer w0.152: 15.02,16.31 15.91,16.31 16.02,16.42 USB1.5 ; 15.02,16.31 USB1.7 ; 15.02,16.31 15.02,13.62
DP: length 7.4
  Top Layer w0.152: USB1.6 15.52,18.98 15.4,19.1 14.64,19.1 14.52,18.99 USB1.8 14.52,13.62
MPU_SCL: length 24.3
  Inner3 w0.152: v1(24.59,6.66) 24.59,10.06 24.9,10.36 38.41,10.36 v1(39.43,11.38)
  Bottom Layer w0.152: v1(39.43,11.38) 39.43,11.38 U2.92 ; v1(24.59,6.66) 24.59,6.66 U5.10
MPU_SDA: length 22.1
  Inner3 w0.152: v1(24.13,9.19) 24.13,10.26 24.64,10.77 38.05,10.77 39.17,11.88 v1(39.83,11.88)
  Bottom Layer w0.152: 20.57,9.2 24.13,9.2 v1(24.13,9.19) ; U2.93 v1(39.83,11.88)
OLED_A0: length 8.4
  Top Layer w0.152: v1(42.58,5.89) 38.77,5.89 38.4,6.25 U6.12
  Bottom Layer w0.152: v1(42.58,5.89) 42.57,5.88 U2.81
OLED_CS: length 7.8
  Top Layer w0.152: U6.11 v1(38.89,6.95)
  Bottom Layer w0.152: v1(38.89,6.95) 38.89,6.88 38.87,6.86 38.87,4.93 38.97,4.83 39.73,4.83 39.83,4.72 39.83,4.01 39.97,3.87 40.91,3.87 U2.77
OLED_RES: length 7.3
  Top Layer w0.152: U6.13 38.34,5.55 38.51,5.39 v1(42.07,5.39)
  Bottom Layer w0.152: U2.80 v1(42.07,5.38)
OLED_SCL: length 12.2
  Top Layer w0.152: v1(34.24,2.59) 33.74,2.59 33.48,2.84 33.48,4.01 33.62,4.15 U6.15 41.97,4.15 v1(42.21,4.39)
  Bottom Layer w0.152: v1(42.21,4.39) 42.2,4.38 U2.78 ; v1(34.24,2.59) R66.2
OLED_SI: length 12.6
  Top Layer w0.152: v1(43.39,4.88) 43.39,3.76 43.08,3.45 U6.16 35.72,3.45 v1(35.72,2.62)
  Bottom Layer w0.152: U2.79 43.79,4.88 43.79,4.88
PA0: length 11.5
  Bottom Layer w0.152: U2.22 52.97,18.22 53.42,18.67 55.56,18.67 56.38,17.85 CN1.16
PA1: length 10.9
  Bottom Layer w0.152: U2.23 53.47,18 53.83,18.36 55.21,18.36 56.22,17.35 CN1.18
PA2: length 10.2
  Bottom Layer w0.152: U2.24 53.97,17.79 54.19,18 54.9,18 55.96,16.95 61.81,16.95 61.82,16.94 62.62,16.94 CN1.20
PA3: length 8.8
  Bottom Layer w0.152: U2.25 54.47,16.35 CN1.22
PA4: length 6.9
  Bottom Layer w0.152: U2.28 60.2,14.39 60.74,13.85 CN1.32
PA5: length 6.9
  Bottom Layer w0.152: CN1.34 60.48,13.35 59.94,13.89 U2.29
PA6: length 6.9
  Bottom Layer w0.152: U2.30 59.72,13.39 60.26,12.85 CN1.36
PA7: length 6.9
  Bottom Layer w0.152: U2.31 59.56,12.89 60.1,12.35 CN1.38
PA8: length 22.5
  Top Layer w0.152: CN1.43 51.51,11.1 46.49,6.07 v1(46.49,2.91)
  Bottom Layer w0.152: v1(46.49,2.91) 46.49,1.85 46.47,1.83
PA9: length 23.4
  Top Layer w0.152: v1(45.97,3.26) 45.97,6.38 51.2,11.6 CN1.41
  Bottom Layer w0.152: 45.97,1.84 v1(45.97,3.26)
PA10: length 24.3
  Top Layer w0.152: CN1.39 50.88,12.1 45.47,6.69 v1(45.47,2.91)
  Bottom Layer w0.152: 45.47,1.83 v1(45.47,2.91)
PA11: length 25.2
  Top Layer w0.152: v1(44.97,3.26) 44.97,7.01 50.56,12.6 CN1.37
  Bottom Layer w0.152: 44.97,1.83 v1(44.97,3.26)
PA12: length 26.1
  Top Layer w0.152: CN1.35 50.3,13.1 44.5,7.29 44.5,2.93 v1(44.47,2.91)
  Bottom Layer w0.152: 44.47,1.83 v1(44.47,2.91)
PA13: length 42.7
  Top Layer w0.152: U4.27 17.52,15.33 17.73,15.55 22.39,15.55 R9.1 R8.2 25.3,14.84 25.71,14.43 v1(25.71,3.45)
  Inner3 w0.152: v1(43.85,3.45) v1(25.71,3.45)
  Bottom Layer w0.152: v1(43.85,3.45) 43.97,3.33 U2.72
PA14: length 37.8
  Top Layer w0.152: v1(25.1,3.96) 25.1,13.31 25.05,13.36 R10.1 22.35,12.55 18.24,12.55 18.02,12.77 U4.26
  Inner3 w0.152: v1(42.83,3.96) 32.63,3.96 32.63,3.96 30.72,3.96 30.72,3.96 v1(25.1,3.96)
  Bottom Layer w0.152: U2.76 42.56,3.38 42.83,3.66 v1(42.83,3.96)
PB0: length 6.9
  Bottom Layer w0.152: CN1.44 59.35,10.85 58.81,11.39 U2.34
PB1: length 6.9
  Bottom Layer w0.152: CN1.46 62.71,10.35 59.18,10.35 58.65,10.89 U2.35
PB2: length 6.9
  Bottom Layer w0.152: U2.36 58.49,10.39 59.03,9.85 CN1.48
PB3: length 28.1
  Top Layer w0.152: CN1.9 50.27,19.6 40.56,9.88 v1(39.8,9.88)
  Bottom Layer w0.152: U2.89 v1(39.8,9.88)
PB4: length 28.8
  Top Layer w0.152: v1(39.45,10.38) 40.24,10.38 49.95,20.1 CN1.7
  Bottom Layer w0.152: U2.90 v1(39.45,10.38)
PB5: length 28
  Top Layer w0.152: v1(39.85,10.88) 49.47,20.5 62.62,20.5 CN1.5
  Bottom Layer w0.152: U2.91 v1(39.85,10.88)
PB8: length 27.3
  Top Layer w0.152: v1(39.85,12.9) 41.08,12.9 49.27,21.1 CN1.3
  Bottom Layer w0.152: U2.95 39.87,12.88 v1(39.85,12.9)
PB9: length 28.1
  Top Layer w0.152: v1(39.47,13.33) 40.69,13.33 48.96,21.6 CN1.1
  Bottom Layer w0.152: 39.47,13.34 40.88,13.34 U2.96
PB10: length 6.9
  Bottom Layer w0.152: 62.51,4.84 57.86,4.84 57.32,5.39 55.82,5.39
PB11: length 6.9
  Bottom Layer w0.152: 55.92,4.89 57.21,4.89 57.75,4.35 62.61,4.35
PB12: length 9.4
  Top Layer w0.152: v1(54.48,2.91) 54.66,3.1 CN1.75
  Bottom Layer w0.152: 54.47,1.83 54.47,2.9 v1(54.48,2.91)
PB13: length 10.3
  Top Layer w0.152: v1(53.98,3.26) 54.31,3.6 CN1.73
  Bottom Layer w0.152: 53.97,1.83 53.97,3.26 v1(53.98,3.26)
PB14: length 11.1
  Top Layer w0.152: v1(53.47,2.91) 53.47,2.91 53.47,3.47 54.1,4.1 CN1.71
  Bottom Layer w0.152: 53.47,1.83 v1(53.47,2.91)
PB15: length 11.9
  Top Layer w0.152: CN1.69 53.99,4.6 52.96,3.57 52.96,3.28 v1(52.97,3.26)
  Bottom Layer w0.152: 52.97,1.83 v1(52.97,3.26)
PC4: length 6.9
  Bottom Layer w0.152: U2.32 59.29,12.39 59.83,11.85 CN1.40
PC5: length 6.9
  Bottom Layer w0.152: U2.33 59.08,11.89 59.62,11.35 CN1.42
PC6: length 19.1
  Top Layer w0.152: v1(48.47,2.91) 48.47,5.05 52.52,9.1 CN1.51
  Bottom Layer w0.152: 48.47,1.83 v1(48.47,2.91)
PC7: length 20
  Top Layer w0.152: v1(47.97,3.26) 47.97,5.26 52.31,9.6 CN1.49
  Bottom Layer w0.152: 47.97,1.83 v1(47.97,3.26)
PC8: length 20.8
  Top Layer w0.152: CN1.47 52.04,10.1 47.45,5.51 47.45,2.93 v1(47.47,2.91)
  Bottom Layer w0.152: 47.47,1.83 v1(47.47,2.91)
PC9: length 21.7
  Top Layer w0.152: CN1.45 62.67,10.56 51.74,10.56 47,5.81 v1(47,3.31)
  Bottom Layer w0.152: 46.97,1.83 47,1.86 v1(47,3.31)
PD1: length 28.8
  Top Layer w0.152: CN1.23 52.53,16.1 42.82,6.38 v1(39.45,6.38)
  Bottom Layer w0.152: U2.82 v1(39.45,6.38)
PD2: length 28.1
  Top Layer w0.152: CN1.21 52.27,16.6 42.56,6.88 v1(39.8,6.88)
  Bottom Layer w0.152: U2.83 v1(39.8,6.88)
PD3: length 28.8
  Top Layer w0.152: v1(39.45,7.38) 42.14,7.38 51.85,17.1 CN1.19
  Bottom Layer w0.152: U2.84 v1(39.45,7.38)
PD4: length 28.1
  Top Layer w0.152: CN1.17 51.48,17.6 41.77,7.88 v1(39.8,7.88)
  Bottom Layer w0.152: U2.85 v1(39.8,7.88)
PD5: length 28.8
  Top Layer w0.152: CN1.15 51.12,18.1 41.41,8.38 v1(39.45,8.38)
  Bottom Layer w0.152: U2.86 v1(39.45,8.38)
PD6: length 28.1
  Top Layer w0.152: CN1.13 50.8,18.6 41.09,8.88 v1(39.8,8.88)
  Bottom Layer w0.152: U2.87 v1(39.8,8.88)
PD7: length 28.8
  Top Layer w0.152: CN1.11 50.54,19.1 40.82,9.38 v1(39.45,9.38)
  Bottom Layer w0.152: U2.88 v1(39.45,9.38)
PD8: length 12.7
  Top Layer w0.152: v1(52.47,2.91) 52.47,3.69 53.88,5.1 CN1.67
  Bottom Layer w0.152: 52.47,1.83 v1(52.47,2.91)
PD9: length 13.5
  Top Layer w0.152: v1(51.97,3.26) 51.97,3.81 53.76,5.6 CN1.65
  Bottom Layer w0.152: 51.97,1.83 v1(51.97,3.26)
PD10: length 14.2
  Top Layer w0.152: v1(51.48,2.91) 51.48,3.93 53.65,6.1 CN1.63
  Bottom Layer w0.152: v1(51.48,2.91) 51.48,1.84 51.47,1.83
PD11: length 15
  Top Layer w0.152: CN1.61 53.49,6.6 50.97,4.08 50.97,3.27
  Bottom Layer w0.152: 50.97,1.83 v1(50.97,3.26)
PD12: length 15.8
  Top Layer w0.152: v1(50.47,2.91) 50.47,4.24 53.33,7.1 CN1.59
  Bottom Layer w0.152: 50.47,1.83 v1(50.47,2.91)
PD13: length 16.6
  Top Layer w0.152: v1(49.97,3.26) 49.97,4.41 53.16,7.6 CN1.57
  Bottom Layer w0.152: 49.97,1.83 v1(49.97,3.26)
PD14: length 17.5
  Top Layer w0.152: CN1.55 52.95,8.1 49.49,4.64 49.49,2.93 v1(49.47,2.91)
  Bottom Layer w0.152: 49.47,1.83 v1(49.47,2.91)
PD15: length 18.3
  Top Layer w0.152: v1(48.97,3.26) 48.97,4.83 52.73,8.6 CN1.53
  Bottom Layer w0.152: 48.97,1.83 v1(48.97,3.26)
PE4: length 46.7
  Top Layer w0.152: v1(3.92,21.3) 4.92,21.3 6.6,19.62 6.81,19.62
  Inner3 w0.152: v1(3.92,21.3) 3.92,21.13 4.23,20.82 34.91,20.82 35.21,20.52 35.21,18.75 35.77,18.19 43.32,18.19 v1(43.47,18.03)
  Bottom Layer w0.152: U2.3 v1(43.47,18.03)
PE7: length 6.9
  Bottom Layer w0.152: CN1.50 62.7,9.33 58.88,9.33 58.33,9.89 U2.37
PE8: length 6.9
  Bottom Layer w0.152: U2.38 58.16,9.39 58.7,8.85 CN1.52
PE9: length 6.9
  Bottom Layer w0.152: CN1.54 58.64,8.35 58.1,8.89 U2.39
PE10: length 6.9
  Bottom Layer w0.152: CN1.56 62.71,7.85 58.52,7.85 57.99,8.39 U2.40
PE11: length 6.9
  Bottom Layer w0.152: CN1.58 58.42,7.35 57.88,7.89 U2.41
PE12: length 6.9
  Bottom Layer w0.152: CN1.60 58.31,6.85 57.77,7.39 U2.42
PE13: length 6.9
  Bottom Layer w0.152: CN1.62 58.14,6.35 57.6,6.89 U2.43
PE14: length 6.9
  Bottom Layer w0.152: U2.44 57.49,6.39 58.03,5.85 CN1.64
PE15: length 6.9
  Bottom Layer w0.152: CN1.66 57.97,5.35 57.43,5.89 U2.45
VCAP1: length 6.8
  Bottom Layer w0.152: U2.73 43.47,1.89 43.49,1.9 43.49,2.74 43.29,2.95 39.13,2.95
  Bottom Layer w0.305: C23.2 C24.2
VREF+: length 4.7
  Bottom Layer w0.152: U2.20 U2.21 52.47,18.91 C25.2 54.49,19.34 R14.2
$1N1959: length 1.6
  Top Layer w0.152: LED1.2 7.94,2.65 6.39,2.65
$1N1960: length 3.8
  Top Layer w0.152: RT9013.3 1.06,5.8 1.22,5.64 2.8,5.64 2.95,5.79 2.95,6.65 RT9013.1
$1N3867: length 3.6
  Bottom Layer w0.152: 44.73,21.21 46.44,21.21 R4.1 46.45,22.69 46.7,22.95
$1N3874: length 2.5
  Bottom Layer w0.152: R13.2 51.47,19.2 U2.19
$1N3903: length 4.7
  Bottom Layer w0.305: C21.1 C22.1 ; 57.46,2.34 57.45,2.35 57.45,4.08 57.15,4.39 U2.48
$1N5342: length 4.3
  Bottom Layer w0.152: U2.12 47.97,21.19 R4.2
$1N5395: length 2
  Bottom Layer w0.152: 40.51,23 42.49,23 42.53,22.96
$1N7049: length 4.2
  Top Layer w0.152: C13.2 18.18,3.2 X2.3 15.52,3.79 U4.6
$1N7718: length 1.7
  Top Layer w0.152: v1(13.52,19.76) 13.52,19.76 USB1.10
$1N7761: length 1.8
  Top Layer w0.152: USB1.4 v1(16.52,19.86)
$1N7868: length 6.3
  Top Layer w0.152: TP1.1 9.07,12.6 13.87,12.6 14.03,12.75 14.03,13.62 U4.34
$1N7872: length 3.1
  Top Layer w0.152: TP2.1 9.62,12.12 U4.37
$1N7979: length 4.2
  Top Layer w0.152: R8.1 21.65,14.83 18.7,14.83 18.52,14.66 U4.25
$1N8280: length 9.1
  Top Layer w0.152: U4.30 16.02,12.56 v1(16.01,12.55)
  Inner3 w0.152: v1(16.01,12.55) 9.15,12.55 8.97,12.73 v1(8.97,13.65)
$1N8284: length 1.6
  Top Layer w0.152: LED3.2 7.46,15.14 R11.2
$1N8434: length 1.7
  Top Layer w0.152: U4.20 21.63,10.12 R12.2
$1N8564: length 6.7
  Top Layer w0.152: 21.76,6.02 21.63,6.15 16.21,6.15 16.03,5.97 16.03,5.13 U4.7
$1N12613: length 5.8
  Top Layer w0.152: U6.2 31.24,13.25 30.98,13.52 30.98,14.16 v1(30.99,14.18)
$1N12618: length 3.7
  Top Layer w0.152: U6.1 32.62,13.95 v1(32.39,14.18)
$1N12623: length 5.7
  Top Layer w0.152: U6.4 31.26,11.85 30.99,12.12 v1(30.99,12.75)
$1N12629: length 3.7
  Top Layer w0.152: U6.3 32.59,12.55 v1(32.39,12.75)
$1N12870: length 6.5
  Top Layer w0.152: U6.10 33.53,7.65 33.38,7.5 33.38,6.02 33.07,5.71 v1(32.49,5.71) 32.49,4.43 v1(32.45,4.39)
$1N12999: length 5.3
  Top Layer w0.152: U6.8 33.15,9.05 32.92,8.82 32.92,7.19 32.77,7.04 v1(32.45,7.04)
$1N13129: length 5
  Top Layer w0.152: 32.39,10.44 v1(32.39,9.89) ; 32.39,10.44 32.4,10.45 U6.6 ; 32.39,10.44 v1(32.39,11.32)
$1N13135: length 4.5
  Top Layer w0.152: v1(32.39,8.47) 32.39,9.11 33.03,9.75 U6.7
$1N13313: length 6.6
  Top Layer w0.152: C12.1 13.88,1.46 X2.1 14.15,1.5 15.02,2.37 U4.5

## Copper pours and planes (outline as drawn; the poured copper is in the pictures)
3V3 on Top Layer: 0.92,4.98 3.61,4.98 3.61,0.25 0.92,0.25
3V3 on Bottom Layer: 55.35,23.01 63.54,23.01 63.54,18.18 55.35,18.18
3V3 on Inner2: 0.26,24.74 63.76,24.74 63.76,0.26 0.26,0.26
5V on Bottom Layer: 56.53,23.91 63.53,23.91 63.53,19.18 56.53,19.18
5V on Inner2: 2.53,18.95 17.95,18.95 17.95,12.79 2.53,12.79
GND on Bottom Layer: 58.26,24.49 63.54,24.49 63.54,20.18 58.26,20.18
GND on Bottom Layer: 58.24,4.01 63.53,4.01 63.53,0.45 58.24,0.45
GND on Inner1: 0.26,24.74 63.76,24.74 63.76,0.26 0.26,0.26
GND on Inner4: 0.26,24.74 63.76,24.74 63.76,0.26 0.26,0.26
$1N1960 on Top Layer: 2.49,11.38 4.27,11.38 4.27,5.99 2.49,5.99

Small or netless copper shapes (teardrops, artwork), in the pictures only: 16 on Inner1, 16 on Inner4

## Text on the board
Top Silkscreen Layer: Hello_World!!!
